# Altium schematic sheet RS485_LoRa_Gateway_3.SchDoc
size A3; SheetNumber: 3; SheetTotal: 3
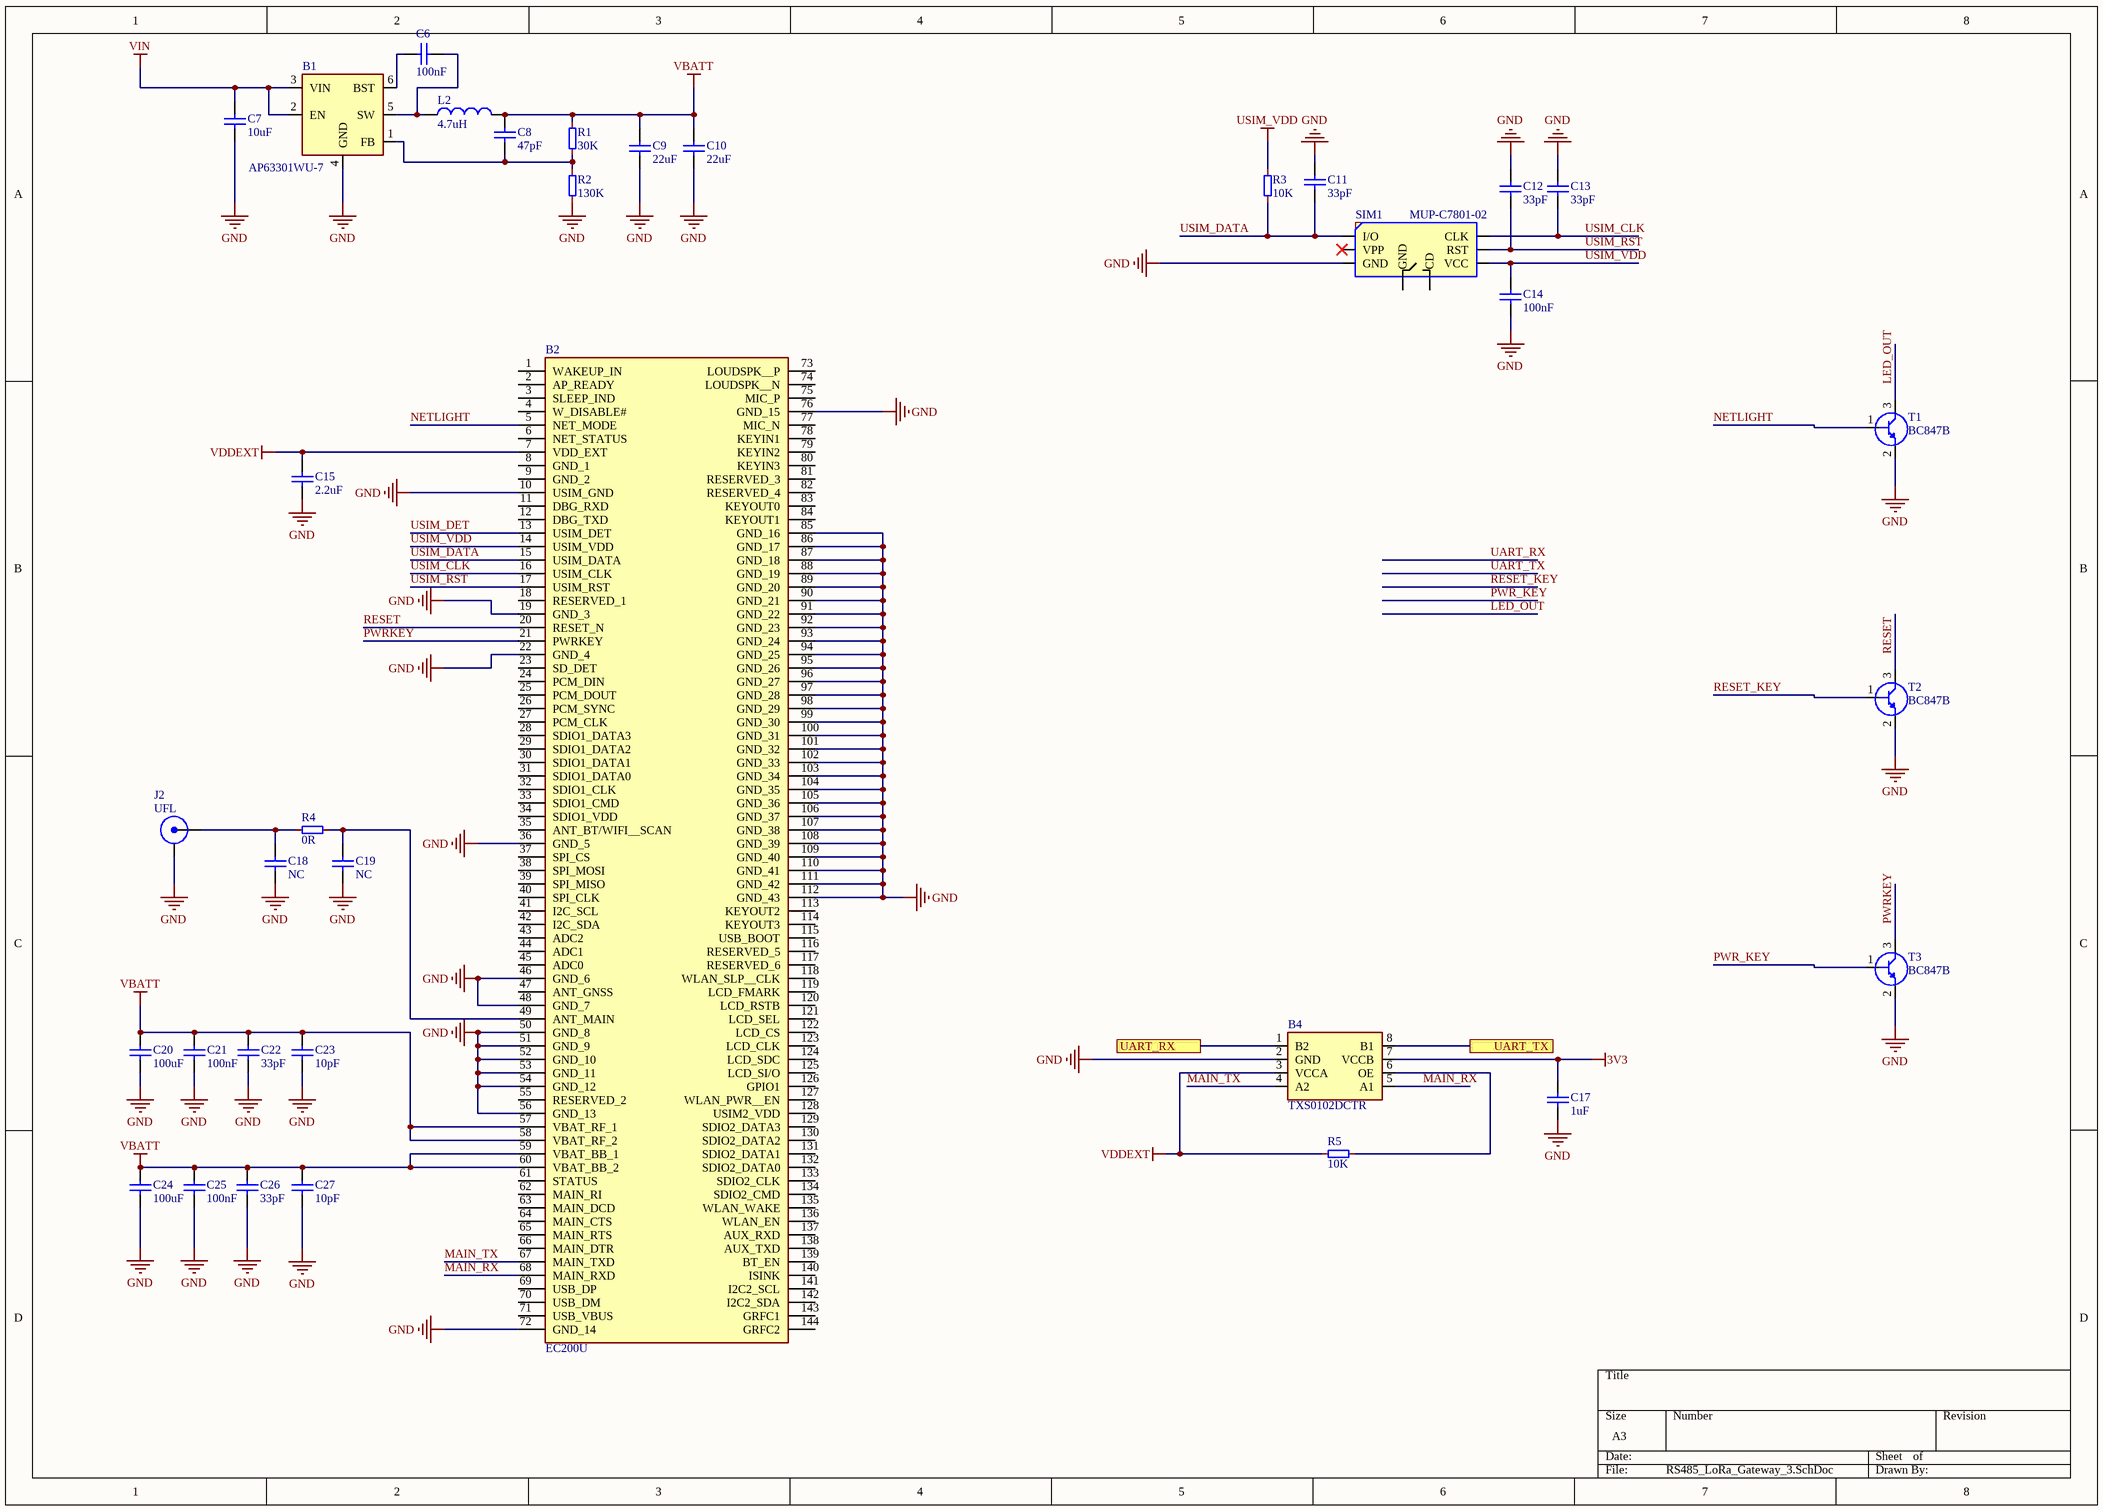
[diagram p0: RS485_LoRa_Gateway_3.SchDoc]

## Parts
B1  AP63301WU-7  [SOT95P280X100-6N]
B2  EC200U  [EC200U]
B4  TXS0102DCTR  [SOP65P400X130-8N]
C6  100nF  [CAP0402]
C7  10uF  [CAP0805]
C8  47pF  [CAP0402]
C9  22uF  [CAP0805]
C10  22uF  [CAP0805]
C11  33pF  [CAP0402]
C12  33pF  [CAP0402]
C13  33pF  [CAP0402]
C14  100nF  [CAP0402]
C15  2.2uF  [CAP0402]
C17  1uF  [CAP0402]
C18  NC  [CAP0402]  (net tie, no BOM)
C19  NC  [CAP0402]  (net tie, no BOM)
C20  100uF  [CAP1206]
C21  100nF  [CAP0402]
C22  33pF  [CAP0402]
C23  10pF  [CAP0402]
C24  100uF  [CAP1206]
C25  100nF  [CAP0402]
C26  33pF  [CAP0402]
C27  10pF  [CAP0402]
J2  UFL  [UFL]
L2  4.7uH  [IND_5.0x5.0x4.0]
R1  30K  [RESC0402]
R2  130K  [RESC0402]
R3  10K  [RESC0402]
R4  0R  [RESC0402]
R5  10K  [RESC0402]
SIM1  MUP-C7801-02  [MUP-C7801-2]
T1  BC847B  [SOT23]
T2  BC847B  [SOT23]
T3  BC847B  [SOT23]

## Ports
UART_RX (see RS485_LoRa_Gateway_2[1A]), UART_TX (see RS485_LoRa_Gateway_2[1A])

## Nets
3V3: B4.7(VCCB) C17.2
GND: B1.4(GND) B2.10(USIM_GND) B2.19(GND_3) B2.22(GND_4) B2.36(GND_5) B2.46(GND_6) B2.48(GND_7) B2.50(GND_8) B2.51(GND_9) B2.52(GND_10) B2.53(GND_11) B2.54(GND_12) B2.56(GND_13) B2.72(GND_14) B2.76(GND_15) B2.85(GND_16) B2.86(GND_17) B2.87(GND_18) B2.88(GND_19) B2.89(GND_20) B2.90(GND_21) B2.91(GND_22) B2.92(GND_23) B2.93(GND_24) B2.94(GND_25) B2.95(GND_26) B2.96(GND_27) B2.97(GND_28) B2.98(GND_29) B2.99(GND_30) B2.100(GND_31) B2.101(GND_32) B2.102(GND_33) B2.103(GND_34) B2.104(GND_35) B2.105(GND_36) B2.106(GND_37) B2.107(GND_38) B2.108(GND_39) B2.109(GND_40) B2.110(GND_41) B2.111(GND_42) B2.112(GND_43) B4.2(GND) C7.1 C9.1 C10.1 C11.1 C12.1 C13.1 C14.2 C15.1 C17.1 C18.1 C19.1 C20.1 C21.2 C22.2 C23.2 C24.1 C25.2 C26.2 C27.2 J2.2(Y) R2.1 SIM1.GND T1.2(E) T2.2(E) T3.2(E)
USIM_VDD: B2.14(USIM_VDD) C14.1 R3.1 SIM1.VCC
VBATT: B2.57(VBAT_RF_1) B2.58(VBAT_RF_2) B2.59(VBAT_BB_1) B2.60(VBAT_BB_2) C8.1 C9.2 C10.2 C20.2 C21.1 C22.1 C23.1 C24.2 C25.1 C26.1 C27.1 L2.2 R1.2
VDDEXT: B2.7(VDD_EXT) B4.3(VCCA) C15.2 R5.1
VIN: B1.2(EN) B1.3(VIN) C7.2
LED_OUT: T1.3(C)
MAIN_RX: B2.68(MAIN_RXD) B4.5(A1)
MAIN_TX: B2.67(MAIN_TXD) B4.4(A2)
NETLIGHT: B2.5(NET_MODE) T1.1(B)
PWR_KEY: T3.1(B)
PWRKEY: B2.21(PWRKEY) T3.3(C)
RESET: B2.20(RESET_N) T2.3(C)
RESET_KEY: T2.1(B)
UART_RX: B4.1(B2) ; port UART_RX
UART_TX: B4.8(B1) ; port UART_TX
USIM_CLK: B2.16(USIM_CLK) C13.2 SIM1.CLK
USIM_DATA: B2.15(USIM_DATA) C11.2 R3.2 SIM1.I/O
USIM_DET: B2.13(USIM_DET)
USIM_RST: B2.17(USIM_RST) C12.2 SIM1.RST
NetB1_1: B1.1(FB) C8.2 R1.1 R2.2
NetB1_5: B1.5(SW) C6.2 L2.1
NetB1_6: B1.6(BST) C6.1
NetB2_49: B2.49(ANT_MAIN) C19.2 R4.2
NetB4_6: B4.6(OE) R5.2
NetC18_2: C18.2 J2.1(X) R4.1

Not connected (* = marked no-connect by the designer): B2 1(WAKEUP_IN) 2(AP_READY) 3(SLEEP_IND) 4(W_DISABLE#) 6(NET_STATUS) 8(GND_1) 9(GND_2) 11(DBG_RXD) 12(DBG_TXD) 18(RESERVED_1) 23(SD_DET) 24(PCM_DIN) 25(PCM_DOUT) 26(PCM_SYNC) 27(PCM_CLK) 28(SDIO1_DATA3) 29(SDIO1_DATA2) 30(SDIO1_DATA1) 31(SDIO1_DATA0) 32(SDIO1_CLK) 33(SDIO1_CMD) 34(SDIO1_VDD) 35(ANT_BT/WIFI__SCAN) 37(SPI_CS) 38(SPI_MOSI) 39(SPI_MISO) 40(SPI_CLK) 41(I2C_SCL) 42(I2C_SDA) 43(ADC2) 44(ADC1) 45(ADC0) 47(ANT_GNSS) 55(RESERVED_2) 61(STATUS) 62(MAIN_RI) 63(MAIN_DCD) 64(MAIN_CTS) 65(MAIN_RTS) 66(MAIN_DTR) 69(USB_DP) 70(USB_DM) 71(USB_VBUS) 73(LOUDSPK__P) 74(LOUDSPK__N) 75(MIC_P) 77(MIC_N) 78(KEYIN1) 79(KEYIN2) 80(KEYIN3) 81(RESERVED_3) 82(RESERVED_4) 83(KEYOUT0) 84(KEYOUT1) 113(KEYOUT2) 114(KEYOUT3) 115(USB_BOOT) 116(RESERVED_5) 117(RESERVED_6) 118(WLAN_SLP__CLK) 119(LCD_FMARK) 120(LCD_RSTB) 121(LCD_SEL) 122(LCD_CS) 123(LCD_CLK) 124(LCD_SDC) 125(LCD_SI/O) 126(GPIO1) 127(WLAN_PWR__EN) 128(USIM2_VDD) 129(SDIO2_DATA3) 130(SDIO2_DATA2) 131(SDIO2_DATA1) 132(SDIO2_DATA0) 133(SDIO2_CLK) 134(SDIO2_CMD) 135(WLAN_WAKE) 136(WLAN_EN) 137(AUX_RXD) 138(AUX_TXD) 139(BT_EN) 140(ISINK) 141(I2C2_SCL) 142(I2C2_SDA) 143(GRFC1) 144(GRFC2); SIM1 CD VPP*

## Library data of the parts
B1 = AP63301WU-7: 3.8V TO 32V INPUT, 3A LOW IQ SYNCHRONOUS BUCK WITH ENHANCED EMI REDUCTION.; Manufacturer: Diodes Incorporated; Geometry.Height: 1mm; Mouser Part Number: 621-AP63301WU-7; Mouser Price/Stock: https://www.mouser.co.uk/ProductDetail/Diodes-Incorporated/AP63301WU-7?qs=bZr6mbWTK5mxozg17S0lNg%3D%3D; Manufacturer_Part_Number: AP63301WU-7; Datasheet Link: https://www.diodes.com//assets/Datasheets/AP63300-AP63301.pdf
B2 = EC200U: LTE standard module Bluetooth wireless communication 4G cat1 module all-network; Manufacturer_Name: Quectel; Geometry.Height: 2.6mm; Manufacturer_Part_Number: EC200U; Mouser Part Number: *; Mouser Price/Stock: *; Arrow Part Number: *; Arrow Price/Stock: *; Datasheet Link: https://drive.google.com/file/d/1eptLu98ynaKmYC8Qn_q-jmLHFTbR9duW/view?usp=sharing
B4 = TXS0102DCTR: Translation - Voltage Levels 2B Bidir Vltg-Level Translator; Manufacturer: Texas Instruments; Geometry.Height: 1.3mm; Mouser Part Number: TXS0102DCTR; Mouser Price/Stock: https://www.mouser.co.uk/ProductDetail/Texas-Instruments/TXS0102DCTTE4?qs=IUbkBnfnSQLBbpjVS5PRXQ%3D%3D; Manufacturer_Part_Number: TXS0102DCTR; Datasheet Link: https://www.ti.com/lit/ds/symlink/txs0102.pdf?ts=1619522054575&ref_url=https%253A%252F%252Fwww.ti.com%252Fstore%252Fti%252Fen%252Fp%252Fproduct%252F%253Fp%253DTXS0102DCTT
C6 C14 C21 C25 = Capa_0402: Ceramic Capacitor C0G, NP0 0402 100nF 35V; Manufacturer_Part_Number: GRM155R61A104KA01J; Manufacturer: MURATA
C7 = Capa_0805: Ceramic Capacitor C0G, NP0 0805 10uF 50V; Manufacturer_Part_Number: CC0805KKX5R9BB106; Manufacturer: YAGEO
C8 = Capa_0402: Ceramic Capacitor C0G, NP0 0402 47pF 35V; Manufacturer_Part_Number: CC0402JRNPO9BN470; Manufacturer: YAGEO
C9 C10 = Capa_0805: Ceramic Capacitor C0G, NP0 0805 22uF 0805 20%; Manufacturer_Part_Number: 0805B226K500CT; Manufacturer: Walsin
C11-C13 C22 C26 = Capa_0402: 33pF 50V Capacitor 5% Tolerance CC0402JRNPO9BN330- 0402 Package; Manufacturer: YAGEO; Manufacturer_Part_Number: CC0402JRNPO9BN330
C15 = Capa_0402: Ceramic Capacitor C0G, 2.2uF NP0 0402; Manufacturer_Part_Number: CC1206ZKY5V9BB225; Manufacturer: YAGEO
C17 = Capa_0402: Ceramic Capacitor C0G, 1uF NP0 0402; Manufacturer_Part_Number: CC0402KRX7R9BB105; Manufacturer: YAGEO
C18 C19 = Capa_0402: Ceramic Capacitor C0G, NC NP0 0402; Manufacturer_Part_Number: CC0402KRX7R9BB105; Manufacturer: YAGEO
C20 C24 = Capa_1206: MLCC - SMD/SMT 100uF 10 VDC 20% 1206 X6S; Manufacturer_Part_Number: GRM31CR61A107MEA8K; Manufacturer: MURATA
C23 C27 = Capa_0402: Ceramic Capacitor C0G, NP0 0402 10pF 35V; Manufacturer_Part_Number: CC0402JRNPO9BN100; Manufacturer: YAGEO
J2 = SMA_T_9.52_NF: SMA Jack, UFL Edge Mount, 50 Ohms; Manufacturer: SAMTEC; Manufacturer_Part_Number: SMA-J-P-H-ST-EM1
L2 = Inductor: 4.7uH 3A 20% 39mOhm Shielded Wirewound Power Inductor SMD; Manufacturer_Part_Number: SWPA5040S4R7MT; Manufacturer: Shenzhen Sunlord
R1 = Resister: 30K 1% 0402 SMD Thick-Film Chip Resistor - Royal Ohm; Manufacturer_Part_Number: 0402WGF3002TCE; Package: 0402; Manufacturer: Royal Ohm
R2 = Resister: 130K 1% 0402 SMD Thick-Film Chip Resistor - Royal Ohm; Manufacturer_Part_Number: 0402WGF1303TCE; Package: 0402; Manufacturer: Royal Ohm
R3 R5 = Resister: 10K 1% 0402 SMD Thick-Film Chip Resistor - WALSIN; Manufacturer_Part_Number: WR04X1002FTL; Package: 0402; Manufacturer: WALSIN
R4 = Resister: 0R 1% 0402 SMD Thick-Film Chip Resistor - Yageo; Manufacturer_Part_Number: RC0402FR-070RL; Package: 0402; Manufacturer: YAGEO
SIM1 = MUP-C7801-02: MUP-C7801-02 – Push-Push Nano Sim Card Connector Without Post Normally Closed – 7Pin SMD Package; Manufacturer: MUP Industrial; Manufacturer_Part_Number: MUP-C7801-02
T1-T3 = BC847: BC847B – NPN General Purpose Transistor – SOT-23 Package; Manufacturer: Nexperia; Package: SOT23; Manufacturer_Part_Number: BC847B; Supplier-2: *